# Altium schematic sheet Memory.SchDoc
size 420 x 297 mm; SheetNumber: 4; SheetTotal: 5
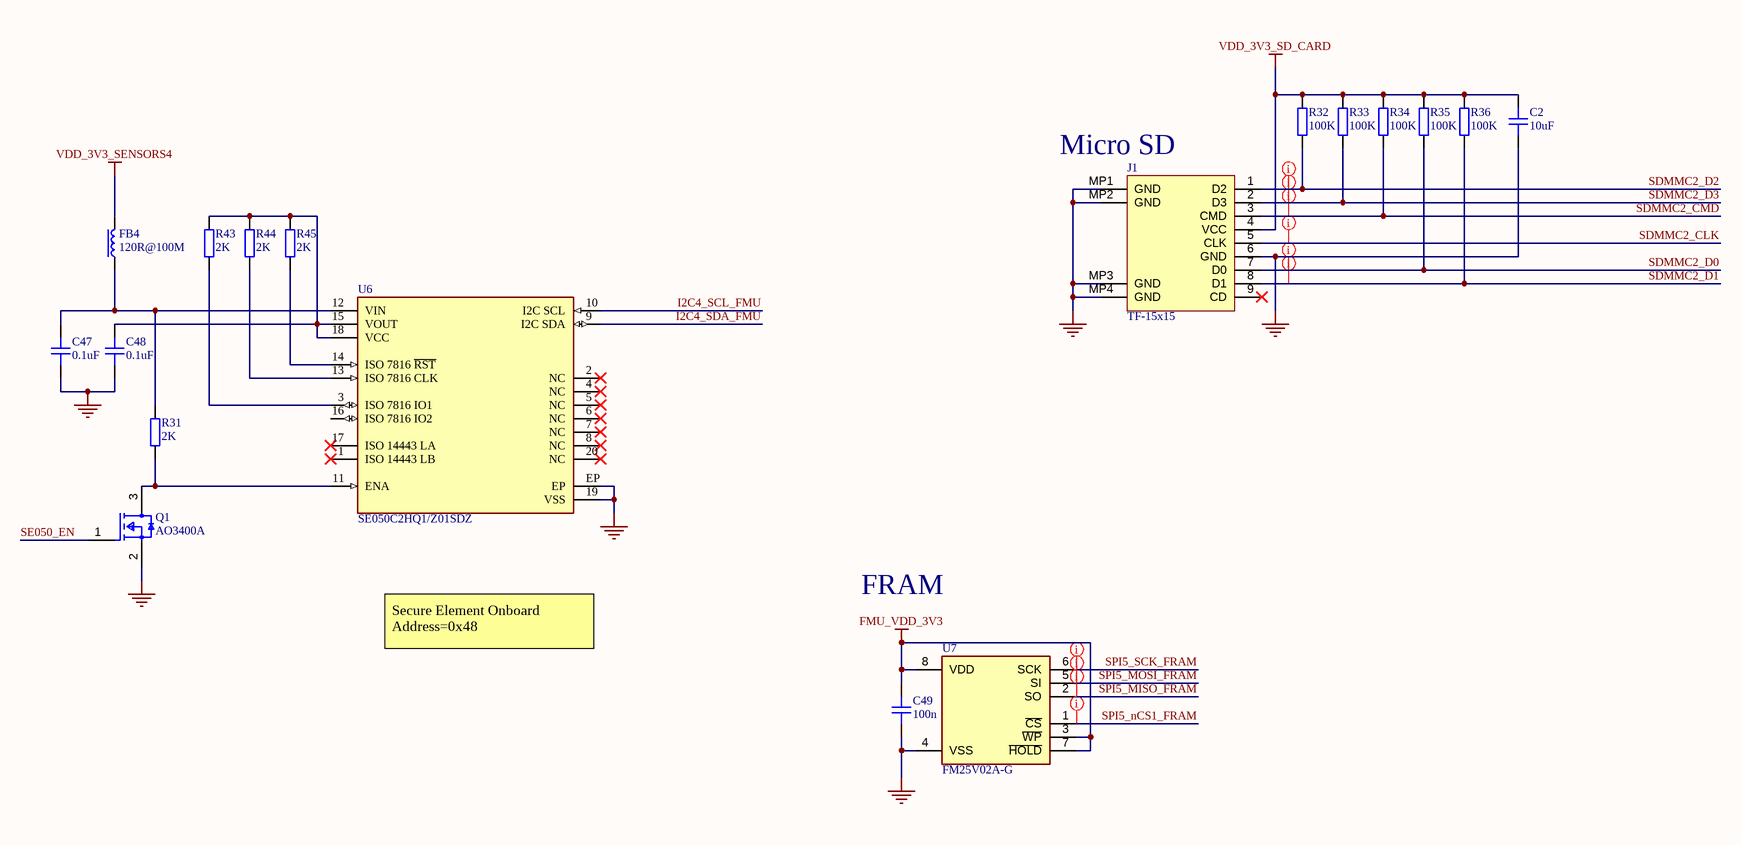
[diagram p0: Memory.SchDoc]

## Parts
C2  10uF  [CAPC1608X10N]
C47  0.1uF  [CAPC1005X05N]
C48  0.1uF  [CAPC1005X05N]
C49  100n  [CAPC1005X05N]
FB4  120R@100M  [INDC1005X06N]
J1  TF-15x15  [TF15X15]
Q1  AO3400A  [SOT95P280X125-3N]
R31  2K  [RESC1005X04N]
R32  100K  [RESC1005X04N]
R33  100K  [RESC1005X04N]
R34  100K  [RESC1005X04N]
R35  100K  [RESC1005X04N]
R36  100K  [RESC1005X04N]
R43  2K  [RESC1005X04N]
R44  2K  [RESC1005X04N]
R45  2K  [RESC1005X04N]
U6  SE050C2HQ1/Z01SDZ  [SOT1969-1 NXP]
U7  FM25V02A-G  [SOT127P602X155-8N]

## Nets
FMU_VDD_3V3: C49.2 U7.3(~{WP}) U7.7(~{HOLD}) U7.8(VDD)
GND: C2.1 C47.1 C48.1 C49.1 J1.6(GND) J1.MP1(GND) J1.MP2(GND) J1.MP3(GND) J1.MP4(GND) Q1.2(S) U6.19(VSS) U6.EP U7.4(VSS)
VDD_3V3_SD_CARD: C2.2 J1.4(VCC) R32.2 R33.2 R34.2 R35.2 R36.2
VDD_3V3_SENSORS4: FB4.2
I2C4_SCL_FMU: U6.10(I2C_SCL)
I2C4_SDA_FMU: U6.9(I2C_SDA)
SDMMC2_CLK: J1.5(CLK)
SDMMC2_CMD: J1.3(CMD) R34.1
SDMMC2_D0: J1.7(D0) R35.1
SDMMC2_D1: J1.8(D1) R36.1
SDMMC2_D2: J1.1(D2) R32.1
SDMMC2_D3: J1.2(D3) R33.1
SE050_EN: Q1.1(G)
SPI5_MISO_FRAM: U7.2(SO)
SPI5_MOSI_FRAM: U7.5(SI)
SPI5_nCS1_FRAM: U7.1(~{CS})
SPI5_SCK_FRAM: U7.6(SCK)
NetC47_2: C47.2 FB4.1 R31.2 U6.12(VIN)
NetC48_2: C48.2 R43.2 R44.2 R45.2 U6.15(VOUT) U6.18(VCC)
NetQ1_3: Q1.3(D) R31.1 U6.11(ENA)
NetR43_1: R43.1 U6.3(ISO_7816_IO1)
NetR44_1: R44.1 U6.13(ISO_7816_CLK)
NetR45_1: R45.1 U6.14(ISO_7816_~{RST})

Not connected (* = marked no-connect by the designer): J1 9(CD)*; U6 1(ISO_14443_LB)* 2(NC)* 4(NC)* 5(NC)* 6(NC)* 7(NC)* 8(NC)* 16(ISO_7816_IO2) 17(ISO_14443_LA)* 20(NC)*

## Layout directives
net class SDMMC: SDMMC2_CLK, SDMMC2_CMD, SDMMC2_D0, SDMMC2_D1, SDMMC2_D2, SDMMC2_D3
net class SPI5: SPI5_MISO_FRAM, SPI5_MOSI_FRAM, SPI5_nCS1_FRAM, SPI5_SCK_FRAM

## Notes on the sheet
- (near J1) Micro SD
- Secure Element Onboard
  Address=0x48
- FRAM
- REVISION
- DESCRIPTION
- DATE
- APPROVED
- ENG:
- APPROVALS
- PROJECT
- Xuan Hoa Ward, 72117
- Leman Building
- 20 Truong Dinh
- DSN:
- CHK:
- REFERENCE DOCUMENTS
- PROJECT REVISION:
- TITLE
- DOCUMENT REVISION:
- DESIGN ITEM:
- HCMC, Vietnam
- BOM:
- FAB DWG:
- PCB DWG:
- ASSY DWG:
- FILE NAME
- SIZE
- A3
- DWG NO.
- SHEET
- REV
- OF

## Library data of the parts
C2 = CAP_0603: Capacitor SMD 0603; Manufacturer: *; Manufacturer Part Number: *; Distributor Link: *; LCSC: *; Rating: *; Dielectric: *
C47-C49 = CAP_0402: Capacitor SMD 0402; Manufacturer: *; Manufacturer Part Number: *; Distributor Link: *; LCSC: *; Rating: *; Dielectric: *
FB4 = FB_0402: Ferrite Bead SMD 0402; Manufacturer: *; Manufacturer Part Number: *; Distributor Link: *; LCSC: *
J1 = TF-15x15: -25℃~+85℃ 2mm Connector and Ejector MicroSD Card (TF Card) Push-Push SMD SD Card / Memory Card Connector ROHS
Q1 = 0a9ea7c96deaaede766a5b531c28de0: MOSFET N-CH 30V 5.7A SOT23; Input Capacitance: 630pF; Number of Elements: 1; Rds On Max: 26.5mR; Max Power Dissipation: 1.4W; Gate to Source Voltage (Vgs): 12V; Min Operating Temperature: -55°C; Lead Free: Lead Free; Number of Pins: 3; Drain to Source Voltage (Vdss): 30V; Case/Package: SOT-23; Mount: Surface Mount; Continuous Drain Current (ID): 5.7A; Radiation Hardening: No; Packaging: Tape and Reel; Max Operating Temperature: 150°C; Power Dissipation: 1.4W
R31-R36 R43-R45 = RES_0402: Resistor SMD 0402; Manufacturer: *; Manufacturer Part Number: *; Distributor Link: *; LCSC: *
U6 = 477818e52a7d8a150ec960bcaa5cafa: ECC RSA AES DES MIFARE KDF CL-IF
U7 = FM25V02A-G: NVRAM NVRAM FRAM Memory Serial; Manufacturer_Name: Infineon; Geometry.Height: 1.549mm; Manufacturer_Part_Number: FM25V02A-G; Mouser Part Number: 727-FM25V02A-G; Mouser Price/Stock: https://www.mouser.co.uk/ProductDetail/Infineon-Technologies/FM25V02A-G?qs=IxCaM9nJKKU1F7p7SsPN2Q%3D%3D; Arrow Part Number: FM25V02A-G; Arrow Price/Stock: https://www.arrow.com/en/products/fm25v02a-g/infineon-technologies-ag?region=europe; Datasheet Link: https://componentsearchengine.com/Datasheets/1/FM25V02A-G.pdf